# Altium schematic sheet Connector_Sheet_3.SchDoc
size A4; SheetNumber: 4; SheetTotal: 12
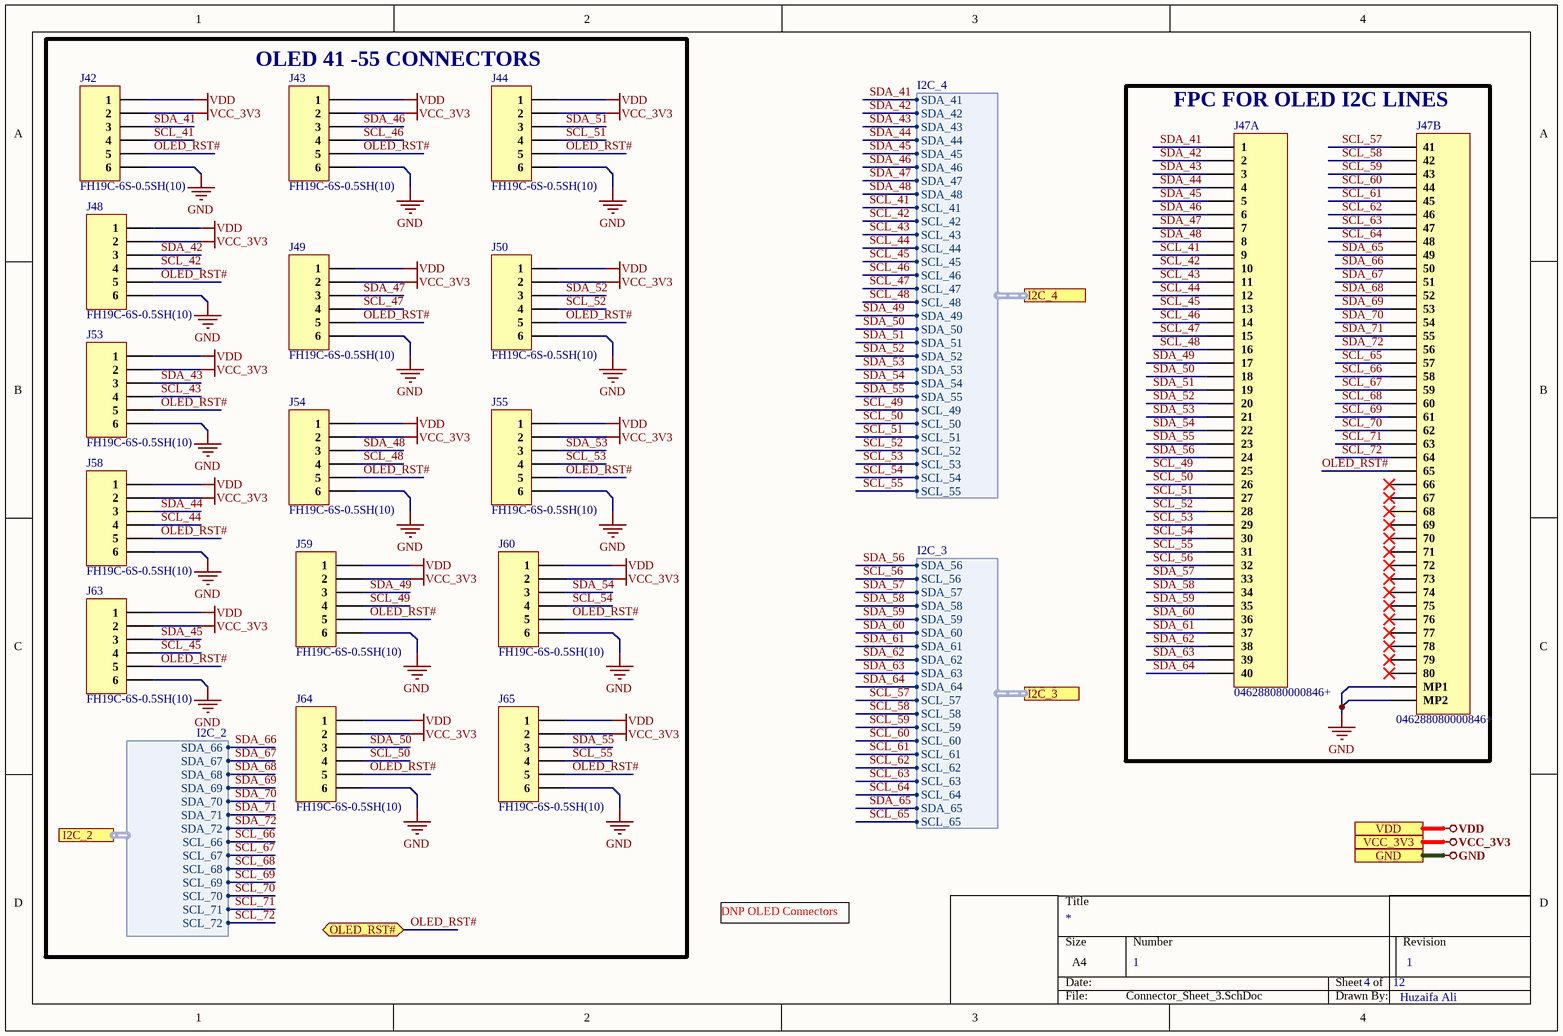
[diagram p0: Connector_Sheet_3.SchDoc]

## Parts
J42  FH19C-6S-0.5SH(10)  [FH19C-6S-0.5SH(10)]
J43  FH19C-6S-0.5SH(10)  [FH19C-6S-0.5SH(10)]
J44  FH19C-6S-0.5SH(10)  [FH19C-6S-0.5SH(10)]
J47  046288080000846+  [046288080000846+]  (parts A,B of 2)
J48  FH19C-6S-0.5SH(10)  [FH19C-6S-0.5SH(10)]
J49  FH19C-6S-0.5SH(10)  [FH19C-6S-0.5SH(10)]
J50  FH19C-6S-0.5SH(10)  [FH19C-6S-0.5SH(10)]
J53  FH19C-6S-0.5SH(10)  [FH19C-6S-0.5SH(10)]
J54  FH19C-6S-0.5SH(10)  [FH19C-6S-0.5SH(10)]
J55  FH19C-6S-0.5SH(10)  [FH19C-6S-0.5SH(10)]
J58  FH19C-6S-0.5SH(10)  [FH19C-6S-0.5SH(10)]
J59  FH19C-6S-0.5SH(10)  [FH19C-6S-0.5SH(10)]
J60  FH19C-6S-0.5SH(10)  [FH19C-6S-0.5SH(10)]
J63  FH19C-6S-0.5SH(10)  [FH19C-6S-0.5SH(10)]
J64  FH19C-6S-0.5SH(10)  [FH19C-6S-0.5SH(10)]
J65  FH19C-6S-0.5SH(10)  [FH19C-6S-0.5SH(10)]

## Blocks framed on the sheet
OLED 41 -55 CONNECTORS: J42-J44 J48-J50 J53-J55 J58-J60 J63-J65
FPC FOR OLED I2C LINES: J47

## Ports
GND, I2C_2 (harness I2C_2), I2C_3 (harness I2C_3), I2C_4 (harness I2C_4), OLED_RST# (bidir), VCC_3V3, VDD

## Harnesses
I2C_2: SDA_66, SDA_67, SDA_68, SDA_69, SDA_70, SDA_71, SDA_72, SCL_66, SCL_67, SCL_68, SCL_69, SCL_70, SCL_71, SCL_72
I2C_3: SDA_56, SCL_56, SDA_57, SDA_58, SDA_59, SDA_60, SDA_61, SDA_62, SDA_63, SDA_64, SCL_57, SCL_58, SCL_59, SCL_60, SCL_61, SCL_62, SCL_63, SCL_64, SDA_65, SCL_65
I2C_4: SDA_41, SDA_42, SDA_43, SDA_44, SDA_45, SDA_46, SDA_47, SDA_48, SCL_41, SCL_42, SCL_43, SCL_44, SCL_45, SCL_46, SCL_47, SCL_48, SDA_49, SDA_50, SDA_51, SDA_52, SDA_53, SDA_54, SDA_55, SCL_49, SCL_50, SCL_51, SCL_52, SCL_53, SCL_54, SCL_55

## Nets
GND: J42.6 J43.6 J44.6 J47.MP1 J47.MP2 J48.6 J49.6 J50.6 J53.6 J54.6 J55.6 J58.6 J59.6 J60.6 J63.6 J64.6 J65.6 ; port GND
VCC_3V3: J42.2 J43.2 J44.2 J48.2 J49.2 J50.2 J53.2 J54.2 J55.2 J58.2 J59.2 J60.2 J63.2 J64.2 J65.2 ; port VCC_3V3
VDD: J42.1 J43.1 J44.1 J48.1 J49.1 J50.1 J53.1 J54.1 J55.1 J58.1 J59.1 J60.1 J63.1 J64.1 J65.1 ; port VDD
OLED_RST#: J42.5 J43.5 J44.5 J47.65 J48.5 J49.5 J50.5 J53.5 J54.5 J55.5 J58.5 J59.5 J60.5 J63.5 J64.5 J65.5 ; port OLED_RST#
SCL_41: J42.4 J47.9 ; port I2C_4.SCL_41
SCL_42: J47.10 J48.4 ; port I2C_4.SCL_42
SCL_43: J47.11 J53.4 ; port I2C_4.SCL_43
SCL_44: J47.12 J58.4 ; port I2C_4.SCL_44
SCL_45: J47.13 J63.4 ; port I2C_4.SCL_45
SCL_46: J43.4 J47.14 ; port I2C_4.SCL_46
SCL_47: J47.15 J49.4 ; port I2C_4.SCL_47
SCL_48: J47.16 J54.4 ; port I2C_4.SCL_48
SCL_49: J47.25 J59.4 ; port I2C_4.SCL_49
SCL_50: J47.26 J64.4 ; port I2C_4.SCL_50
SCL_51: J44.4 J47.27 ; port I2C_4.SCL_51
SCL_52: J47.28 J50.4 ; port I2C_4.SCL_52
SCL_53: J47.29 J55.4 ; port I2C_4.SCL_53
SCL_54: J47.30 J60.4 ; port I2C_4.SCL_54
SCL_55: J47.31 J65.4 ; port I2C_4.SCL_55
SCL_56: J47.32 ; port I2C_3.SCL_56
SCL_57: J47.41 ; port I2C_3.SCL_57
SCL_58: J47.42 ; port I2C_3.SCL_58
SCL_59: J47.43 ; port I2C_3.SCL_59
SCL_60: J47.44 ; port I2C_3.SCL_60
SCL_61: J47.45 ; port I2C_3.SCL_61
SCL_62: J47.46 ; port I2C_3.SCL_62
SCL_63: J47.47 ; port I2C_3.SCL_63
SCL_64: J47.48 ; port I2C_3.SCL_64
SCL_65: J47.57 ; port I2C_3.SCL_65
SCL_66: J47.58 ; port I2C_2.SCL_66
SCL_67: J47.59 ; port I2C_2.SCL_67
SCL_68: J47.60 ; port I2C_2.SCL_68
SCL_69: J47.61 ; port I2C_2.SCL_69
SCL_70: J47.62 ; port I2C_2.SCL_70
SCL_71: J47.63 ; port I2C_2.SCL_71
SCL_72: J47.64 ; port I2C_2.SCL_72
SDA_41: J42.3 J47.1 ; port I2C_4.SDA_41
SDA_42: J47.2 J48.3 ; port I2C_4.SDA_42
SDA_43: J47.3 J53.3 ; port I2C_4.SDA_43
SDA_44: J47.4 J58.3 ; port I2C_4.SDA_44
SDA_45: J47.5 J63.3 ; port I2C_4.SDA_45
SDA_46: J43.3 J47.6 ; port I2C_4.SDA_46
SDA_47: J47.7 J49.3 ; port I2C_4.SDA_47
SDA_48: J47.8 J54.3 ; port I2C_4.SDA_48
SDA_49: J47.17 J59.3 ; port I2C_4.SDA_49
SDA_50: J47.18 J64.3 ; port I2C_4.SDA_50
SDA_51: J44.3 J47.19 ; port I2C_4.SDA_51
SDA_52: J47.20 J50.3 ; port I2C_4.SDA_52
SDA_53: J47.21 J55.3 ; port I2C_4.SDA_53
SDA_54: J47.22 J60.3 ; port I2C_4.SDA_54
SDA_55: J47.23 J65.3 ; port I2C_4.SDA_55
SDA_56: J47.24 ; port I2C_3.SDA_56
SDA_57: J47.33 ; port I2C_3.SDA_57
SDA_58: J47.34 ; port I2C_3.SDA_58
SDA_59: J47.35 ; port I2C_3.SDA_59
SDA_60: J47.36 ; port I2C_3.SDA_60
SDA_61: J47.37 ; port I2C_3.SDA_61
SDA_62: J47.38 ; port I2C_3.SDA_62
SDA_63: J47.39 ; port I2C_3.SDA_63
SDA_64: J47.40 ; port I2C_3.SDA_64
SDA_65: J47.49 ; port I2C_3.SDA_65
SDA_66: J47.50 ; port I2C_2.SDA_66
SDA_67: J47.51 ; port I2C_2.SDA_67
SDA_68: J47.52 ; port I2C_2.SDA_68
SDA_69: J47.53 ; port I2C_2.SDA_69
SDA_70: J47.54 ; port I2C_2.SDA_70
SDA_71: J47.55 ; port I2C_2.SDA_71
SDA_72: J47.56 ; port I2C_2.SDA_72

Not connected (* = marked no-connect by the designer): J47 66* 67* 68* 69* 70* 71* 72* 73* 74* 75* 76* 77* 78* 79* 80*

## Notes on the sheet
- DNP OLED Connectors
- 1
- Huzaifa Ali

## Library data of the parts
J42-J44 J48-J50 J53-J55 J58-J60 J63-J65 = FH19C-6S-0.5SH(10): 0.5mm Pitch, 0.9mm Height, No of Contact 4-50, FPC/FFC Connector, 0.5 A, -55 to 85 ℃, RoHS; Manufacturer: Hirose; Supplier 1: Digi-Key; Manufacturer Part Number: FH19C-6S-0.5SH(10); RoHS: Yes; Category: FFC / FPC; Stock 1: 1159; Pricing 1: 1=1.10000, 10=0.96900, 25=0.91200, 50=0.87400, 100=0.83600, 250=0.76000, 500=0.68400, 1000=0.60800, 2500=0.55100 (USD); ComponentLink1URL: https://datasheet.ciiva.com/18563/ed-fh19cfh19sc-20140305-18563530.pdf?src-supplier=Digi-Key; ComponentLink1Description: https://datasheet.ciiva.com/18563/ed-fh19cfh19sc-20140305-18563530.pdf?src-supplier=Digi-Key; Supplier Part Number 1: H125824CT-ND
J47 = 046288080000846+: 0.5MM PITCH - 80 POS - RIGHT ANG; Manufacturer: Kyocera AVX; Manufacturer Part No: 046288080000846+; Package: Custom; ComponentLink1Description: LCSC; ComponentLink1URL: https://lcsc.com/product-detail/FFC-span-style-background-color-ff0-FPC-span-Connectors_Kyocera-046288080000846_C513346.html